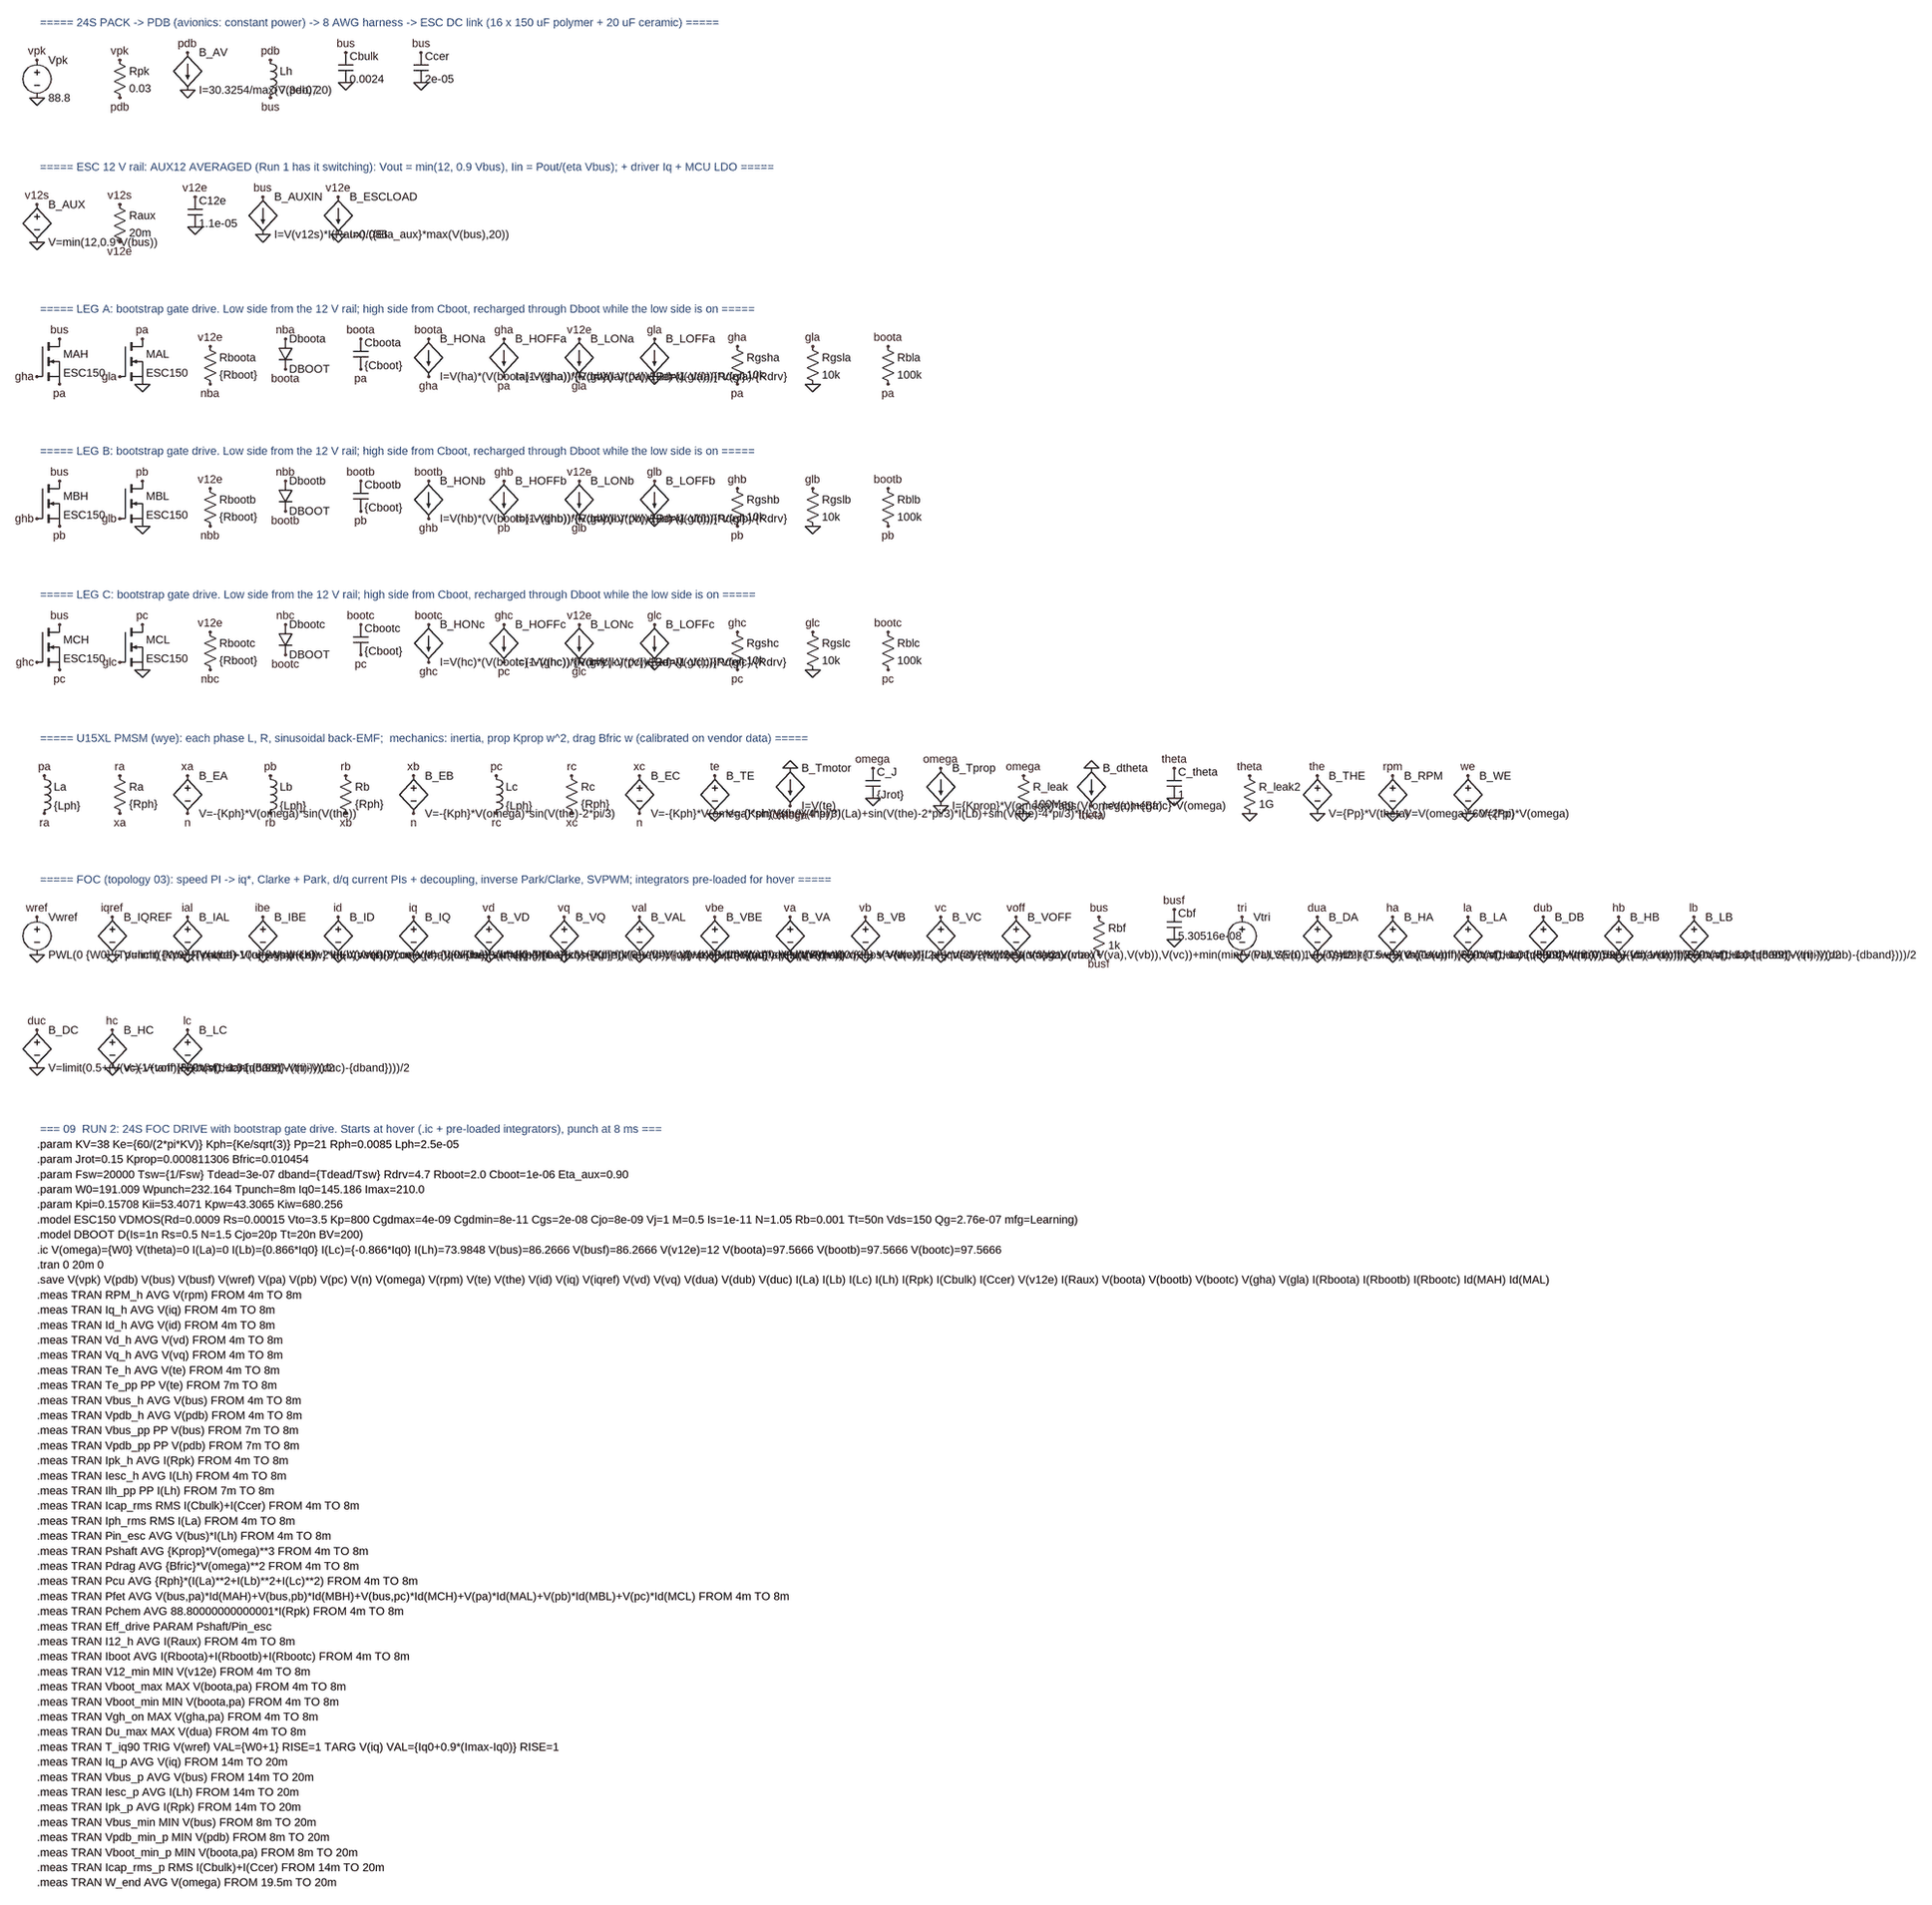
[diagram p0: schematic Drive_24S.asc]
Drive_24S.asc, the LTspice schematic file:
Version 4
SHEET 1 4000 4000
TEXT 32 96 Left 2 ; ===== 24S PACK -> PDB (avionics: constant power) -> 8 AWG harness -> ESC DC link (16 x 150 uF polymer + 20 uF ceramic) =====
SYMBOL voltage 32 160 R0
SYMATTR InstName Vpk
SYMATTR Value 88.8
FLAG 32 176 vpk
FLAG 32 256 0
SYMBOL res 192 160 R0
SYMATTR InstName Rpk
SYMATTR Value 0.03
FLAG 208 176 vpk
FLAG 208 256 pdb
SYMBOL bi 352 160 R0
SYMATTR InstName B_AV
SYMATTR Value I=30.3254/max(V(pdb),20)
FLAG 352 160 pdb
FLAG 352 240 0
SYMBOL ind 512 160 R0
SYMATTR InstName Lh
SYMATTR Value 7.3e-07
SYMATTR SpiceLine Rser=0.0041
FLAG 528 176 pdb
FLAG 528 256 bus
SYMBOL cap 672 160 R0
SYMATTR InstName Cbulk
SYMATTR Value 0.0024
SYMATTR SpiceLine Rser=0.00125
FLAG 688 160 bus
FLAG 688 224 0
SYMBOL cap 832 160 R0
SYMATTR InstName Ccer
SYMATTR Value 2e-05
SYMATTR SpiceLine Rser=1m
FLAG 848 160 bus
FLAG 848 224 0
TEXT 32 456 Left 2 ; ===== ESC 12 V rail: AUX12 AVERAGED (Run 1 has it switching): Vout = min(12, 0.9 Vbus), Iin = Pout/(eta Vbus); + driver Iq + MCU LDO =====
SYMBOL bv 32 520 R0
SYMATTR InstName B_AUX
SYMATTR Value V=min(12,0.9*V(bus))
FLAG 32 536 v12s
FLAG 32 616 0
SYMBOL res 192 520 R0
SYMATTR InstName Raux
SYMATTR Value 20m
FLAG 208 536 v12s
FLAG 208 616 v12e
SYMBOL cap 352 520 R0
SYMATTR InstName C12e
SYMATTR Value 1.1e-05
SYMATTR SpiceLine Rser=0.0025
FLAG 368 520 v12e
FLAG 368 584 0
SYMBOL bi 512 520 R0
SYMATTR InstName B_AUXIN
SYMATTR Value I=V(v12s)*I(Raux)/({Eta_aux}*max(V(bus),20))
FLAG 512 520 bus
FLAG 512 600 0
SYMBOL bi 672 520 R0
SYMATTR InstName B_ESCLOAD
SYMATTR Value I=0.086
FLAG 672 520 v12e
FLAG 672 600 0
TEXT 32 816 Left 2 ; ===== LEG A: bootstrap gate drive. Low side from the 12 V rail; high side from Cboot, recharged through Dboot while the low side is on =====
SYMBOL nmos 32 880 R0
SYMATTR InstName MAH
SYMATTR Value ESC150
FLAG 80 880 bus
FLAG 32 960 gha
FLAG 80 976 pa
SYMBOL nmos 208 880 R0
SYMATTR InstName MAL
SYMATTR Value ESC150
FLAG 256 880 pa
FLAG 208 960 gla
FLAG 256 976 0
SYMBOL res 384 880 R0
SYMATTR InstName Rboota
SYMATTR Value {Rboot}
FLAG 400 896 v12e
FLAG 400 976 nba
SYMBOL diode 544 880 R0
SYMATTR InstName Dboota
SYMATTR Value DBOOT
FLAG 560 880 nba
FLAG 560 944 boota
SYMBOL cap 704 880 R0
SYMATTR InstName Cboota
SYMATTR Value {Cboot}
SYMATTR SpiceLine Rser=5m
FLAG 720 880 boota
FLAG 720 944 pa
SYMBOL bi 864 880 R0
SYMATTR InstName B_HONa
SYMATTR Value I=V(ha)*(V(boota)-V(gha))/{Rdrv}
FLAG 864 880 boota
FLAG 864 960 gha
SYMBOL bi 1024 880 R0
SYMATTR InstName B_HOFFa
SYMATTR Value I=(1-V(ha))*(V(gha)-V(pa))/{Rdrv}
FLAG 1024 880 gha
FLAG 1024 960 pa
SYMBOL bi 1184 880 R0
SYMATTR InstName B_LONa
SYMATTR Value I=V(la)*(V(v12e)-V(gla))/{Rdrv}
FLAG 1184 880 v12e
FLAG 1184 960 gla
SYMBOL bi 1344 880 R0
SYMATTR InstName B_LOFFa
SYMATTR Value I=(1-V(la))*V(gla)/{Rdrv}
FLAG 1344 880 gla
FLAG 1344 960 0
SYMBOL res 1504 880 R0
SYMATTR InstName Rgsha
SYMATTR Value 10k
FLAG 1520 896 gha
FLAG 1520 976 pa
SYMBOL res 1664 880 R0
SYMATTR InstName Rgsla
SYMATTR Value 10k
FLAG 1680 896 gla
FLAG 1680 976 0
SYMBOL res 1824 880 R0
SYMATTR InstName Rbla
SYMATTR Value 100k
FLAG 1840 896 boota
FLAG 1840 976 pa
TEXT 32 1176 Left 2 ; ===== LEG B: bootstrap gate drive. Low side from the 12 V rail; high side from Cboot, recharged through Dboot while the low side is on =====
SYMBOL nmos 32 1240 R0
SYMATTR InstName MBH
SYMATTR Value ESC150
FLAG 80 1240 bus
FLAG 32 1320 ghb
FLAG 80 1336 pb
SYMBOL nmos 208 1240 R0
SYMATTR InstName MBL
SYMATTR Value ESC150
FLAG 256 1240 pb
FLAG 208 1320 glb
FLAG 256 1336 0
SYMBOL res 384 1240 R0
SYMATTR InstName Rbootb
SYMATTR Value {Rboot}
FLAG 400 1256 v12e
FLAG 400 1336 nbb
SYMBOL diode 544 1240 R0
SYMATTR InstName Dbootb
SYMATTR Value DBOOT
FLAG 560 1240 nbb
FLAG 560 1304 bootb
SYMBOL cap 704 1240 R0
SYMATTR InstName Cbootb
SYMATTR Value {Cboot}
SYMATTR SpiceLine Rser=5m
FLAG 720 1240 bootb
FLAG 720 1304 pb
SYMBOL bi 864 1240 R0
SYMATTR InstName B_HONb
SYMATTR Value I=V(hb)*(V(bootb)-V(ghb))/{Rdrv}
FLAG 864 1240 bootb
FLAG 864 1320 ghb
SYMBOL bi 1024 1240 R0
SYMATTR InstName B_HOFFb
SYMATTR Value I=(1-V(hb))*(V(ghb)-V(pb))/{Rdrv}
FLAG 1024 1240 ghb
FLAG 1024 1320 pb
SYMBOL bi 1184 1240 R0
SYMATTR InstName B_LONb
SYMATTR Value I=V(lb)*(V(v12e)-V(glb))/{Rdrv}
FLAG 1184 1240 v12e
FLAG 1184 1320 glb
SYMBOL bi 1344 1240 R0
SYMATTR InstName B_LOFFb
SYMATTR Value I=(1-V(lb))*V(glb)/{Rdrv}
FLAG 1344 1240 glb
FLAG 1344 1320 0
SYMBOL res 1504 1240 R0
SYMATTR InstName Rgshb
SYMATTR Value 10k
FLAG 1520 1256 ghb
FLAG 1520 1336 pb
SYMBOL res 1664 1240 R0
SYMATTR InstName Rgslb
SYMATTR Value 10k
FLAG 1680 1256 glb
FLAG 1680 1336 0
SYMBOL res 1824 1240 R0
SYMATTR InstName Rblb
SYMATTR Value 100k
FLAG 1840 1256 bootb
FLAG 1840 1336 pb
TEXT 32 1536 Left 2 ; ===== LEG C: bootstrap gate drive. Low side from the 12 V rail; high side from Cboot, recharged through Dboot while the low side is on =====
SYMBOL nmos 32 1600 R0
SYMATTR InstName MCH
SYMATTR Value ESC150
FLAG 80 1600 bus
FLAG 32 1680 ghc
FLAG 80 1696 pc
SYMBOL nmos 208 1600 R0
SYMATTR InstName MCL
SYMATTR Value ESC150
FLAG 256 1600 pc
FLAG 208 1680 glc
FLAG 256 1696 0
SYMBOL res 384 1600 R0
SYMATTR InstName Rbootc
SYMATTR Value {Rboot}
FLAG 400 1616 v12e
FLAG 400 1696 nbc
SYMBOL diode 544 1600 R0
SYMATTR InstName Dbootc
SYMATTR Value DBOOT
FLAG 560 1600 nbc
FLAG 560 1664 bootc
SYMBOL cap 704 1600 R0
SYMATTR InstName Cbootc
SYMATTR Value {Cboot}
SYMATTR SpiceLine Rser=5m
FLAG 720 1600 bootc
FLAG 720 1664 pc
SYMBOL bi 864 1600 R0
SYMATTR InstName B_HONc
SYMATTR Value I=V(hc)*(V(bootc)-V(ghc))/{Rdrv}
FLAG 864 1600 bootc
FLAG 864 1680 ghc
SYMBOL bi 1024 1600 R0
SYMATTR InstName B_HOFFc
SYMATTR Value I=(1-V(hc))*(V(ghc)-V(pc))/{Rdrv}
FLAG 1024 1600 ghc
FLAG 1024 1680 pc
SYMBOL bi 1184 1600 R0
SYMATTR InstName B_LONc
SYMATTR Value I=V(lc)*(V(v12e)-V(glc))/{Rdrv}
FLAG 1184 1600 v12e
FLAG 1184 1680 glc
SYMBOL bi 1344 1600 R0
SYMATTR InstName B_LOFFc
SYMATTR Value I=(1-V(lc))*V(glc)/{Rdrv}
FLAG 1344 1600 glc
FLAG 1344 1680 0
SYMBOL res 1504 1600 R0
SYMATTR InstName Rgshc
SYMATTR Value 10k
FLAG 1520 1616 ghc
FLAG 1520 1696 pc
SYMBOL res 1664 1600 R0
SYMATTR InstName Rgslc
SYMATTR Value 10k
FLAG 1680 1616 glc
FLAG 1680 1696 0
SYMBOL res 1824 1600 R0
SYMATTR InstName Rblc
SYMATTR Value 100k
FLAG 1840 1616 bootc
FLAG 1840 1696 pc
TEXT 32 1896 Left 2 ; ===== U15XL PMSM (wye): each phase L, R, sinusoidal back-EMF;  mechanics: inertia, prop Kprop w^2, drag Bfric w (calibrated on vendor data) =====
SYMBOL ind 32 1960 R0
SYMATTR InstName La
SYMATTR Value {Lph}
FLAG 48 1976 pa
FLAG 48 2056 ra
SYMBOL res 192 1960 R0
SYMATTR InstName Ra
SYMATTR Value {Rph}
FLAG 208 1976 ra
FLAG 208 2056 xa
SYMBOL bv 352 1960 R0
SYMATTR InstName B_EA
SYMATTR Value V=-{Kph}*V(omega)*sin(V(the))
FLAG 352 1976 xa
FLAG 352 2056 n
SYMBOL ind 512 1960 R0
SYMATTR InstName Lb
SYMATTR Value {Lph}
FLAG 528 1976 pb
FLAG 528 2056 rb
SYMBOL res 672 1960 R0
SYMATTR InstName Rb
SYMATTR Value {Rph}
FLAG 688 1976 rb
FLAG 688 2056 xb
SYMBOL bv 832 1960 R0
SYMATTR InstName B_EB
SYMATTR Value V=-{Kph}*V(omega)*sin(V(the)-2*pi/3)
FLAG 832 1976 xb
FLAG 832 2056 n
SYMBOL ind 992 1960 R0
SYMATTR InstName Lc
SYMATTR Value {Lph}
FLAG 1008 1976 pc
FLAG 1008 2056 rc
SYMBOL res 1152 1960 R0
SYMATTR InstName Rc
SYMATTR Value {Rph}
FLAG 1168 1976 rc
FLAG 1168 2056 xc
SYMBOL bv 1312 1960 R0
SYMATTR InstName B_EC
SYMATTR Value V=-{Kph}*V(omega)*sin(V(the)-4*pi/3)
FLAG 1312 1976 xc
FLAG 1312 2056 n
SYMBOL bv 1472 1960 R0
SYMATTR InstName B_TE
SYMATTR Value V=-{Kph}*(sin(V(the))*I(La)+sin(V(the)-2*pi/3)*I(Lb)+sin(V(the)-4*pi/3)*I(Lc))
FLAG 1472 1976 te
FLAG 1472 2056 0
SYMBOL bi 1632 1960 R0
SYMATTR InstName B_Tmotor
SYMATTR Value I=V(te)
FLAG 1632 1960 0
FLAG 1632 2040 omega
SYMBOL cap 1792 1960 R0
SYMATTR InstName C_J
SYMATTR Value {Jrot}
FLAG 1808 1960 omega
FLAG 1808 2024 0
SYMBOL bi 1952 1960 R0
SYMATTR InstName B_Tprop
SYMATTR Value I={Kprop}*V(omega)*abs(V(omega))+{Bfric}*V(omega)
FLAG 1952 1960 omega
FLAG 1952 2040 0
SYMBOL res 2112 1960 R0
SYMATTR InstName R_leak
SYMATTR Value 100Meg
FLAG 2128 1976 omega
FLAG 2128 2056 0
SYMBOL bi 2272 1960 R0
SYMATTR InstName B_dtheta
SYMATTR Value I=V(omega)
FLAG 2272 1960 0
FLAG 2272 2040 theta
SYMBOL cap 2432 1960 R0
SYMATTR InstName C_theta
SYMATTR Value 1
FLAG 2448 1960 theta
FLAG 2448 2024 0
SYMBOL res 2592 1960 R0
SYMATTR InstName R_leak2
SYMATTR Value 1G
FLAG 2608 1976 theta
FLAG 2608 2056 0
SYMBOL bv 2752 1960 R0
SYMATTR InstName B_THE
SYMATTR Value V={Pp}*V(theta)
FLAG 2752 1976 the
FLAG 2752 2056 0
SYMBOL bv 2912 1960 R0
SYMATTR InstName B_RPM
SYMATTR Value V=V(omega)*60/(2*pi)
FLAG 2912 1976 rpm
FLAG 2912 2056 0
SYMBOL bv 3072 1960 R0
SYMATTR InstName B_WE
SYMATTR Value V={Pp}*V(omega)
FLAG 3072 1976 we
FLAG 3072 2056 0
TEXT 32 2256 Left 2 ; ===== FOC (topology 03): speed PI -> iq*, Clarke + Park, d/q current PIs + decoupling, inverse Park/Clarke, SVPWM; integrators pre-loaded for hover =====
SYMBOL voltage 32 2320 R0
SYMATTR InstName Vwref
SYMATTR Value PWL(0 {W0} {Tpunch} {W0} {Tpunch+10u} {Wpunch})
FLAG 32 2336 wref
FLAG 32 2416 0
SYMBOL bv 192 2320 R0
SYMATTR InstName B_IQREF
SYMATTR Value V=limit({Kpw}*(V(wref)-V(omega))+{Kiw}*idt(V(wref)-V(omega),{Iq0/Kiw}),-{Imax},{Imax})
FLAG 192 2336 iqref
FLAG 192 2416 0
SYMBOL bv 352 2320 R0
SYMATTR InstName B_IAL
SYMATTR Value V=I(La)
FLAG 352 2336 ial
FLAG 352 2416 0
SYMBOL bv 512 2320 R0
SYMATTR InstName B_IBE
SYMATTR Value V=(I(La)+2*I(Lb))/sqrt(3)
FLAG 512 2336 ibe
FLAG 512 2416 0
SYMBOL bv 672 2320 R0
SYMATTR InstName B_ID
SYMATTR Value V=V(ial)*cos(V(the))+V(ibe)*sin(V(the))
FLAG 672 2336 id
FLAG 672 2416 0
SYMBOL bv 832 2320 R0
SYMATTR InstName B_IQ
SYMATTR Value V=-V(ial)*sin(V(the))+V(ibe)*cos(V(the))
FLAG 832 2336 iq
FLAG 832 2416 0
SYMBOL bv 992 2320 R0
SYMATTR InstName B_VD
SYMATTR Value V={Kpi}*(0-V(id))+{Kii}*idt(0-V(id)) - V(we)*{Lph}*V(iq)
FLAG 992 2336 vd
FLAG 992 2416 0
SYMBOL bv 1152 2320 R0
SYMATTR InstName B_VQ
SYMATTR Value V={Kpi}*(V(iqref)-V(iq))+{Kii}*idt(V(iqref)-V(iq),{Rph*Iq0/Kii}) + V(we)*{Lph}*V(id)+{Kph}*V(omega)
FLAG 1152 2336 vq
FLAG 1152 2416 0
SYMBOL bv 1312 2320 R0
SYMATTR InstName B_VAL
SYMATTR Value V=V(vd)*cos(V(the))-V(vq)*sin(V(the))
FLAG 1312 2336 val
FLAG 1312 2416 0
SYMBOL bv 1472 2320 R0
SYMATTR InstName B_VBE
SYMATTR Value V=V(vd)*sin(V(the))+V(vq)*cos(V(the))
FLAG 1472 2336 vbe
FLAG 1472 2416 0
SYMBOL bv 1632 2320 R0
SYMATTR InstName B_VA
SYMATTR Value V=V(val)
FLAG 1632 2336 va
FLAG 1632 2416 0
SYMBOL bv 1792 2320 R0
SYMATTR InstName B_VB
SYMATTR Value V=-V(val)/2+sqrt(3)/2*V(vbe)
FLAG 1792 2336 vb
FLAG 1792 2416 0
SYMBOL bv 1952 2320 R0
SYMATTR InstName B_VC
SYMATTR Value V=-V(val)/2-sqrt(3)/2*V(vbe)
FLAG 1952 2336 vc
FLAG 1952 2416 0
SYMBOL bv 2112 2320 R0
SYMATTR InstName B_VOFF
SYMATTR Value V=(max(max(V(va),V(vb)),V(vc))+min(min(V(va),V(vb)),V(vc)))/2
FLAG 2112 2336 voff
FLAG 2112 2416 0
SYMBOL res 2272 2320 R0
SYMATTR InstName Rbf
SYMATTR Value 1k
FLAG 2288 2336 bus
FLAG 2288 2416 busf
SYMBOL cap 2432 2320 R0
SYMATTR InstName Cbf
SYMATTR Value 5.30516e-08
FLAG 2448 2320 busf
FLAG 2448 2384 0
SYMBOL voltage 2592 2320 R0
SYMATTR InstName Vtri
SYMATTR Value PULSE(0 1 0 {Tsw/2} {Tsw/2} 0 {Tsw})
FLAG 2592 2336 tri
FLAG 2592 2416 0
SYMBOL bv 2752 2320 R0
SYMATTR InstName B_DA
SYMATTR Value V=limit(0.5+(V(va)-V(voff))/V(busf), 0.01, 0.99)
FLAG 2752 2336 dua
FLAG 2752 2416 0
SYMBOL bv 2912 2320 R0
SYMATTR InstName B_HA
SYMATTR Value V=(1+tanh(500*(V(dua)-{dband}-V(tri))))/2
FLAG 2912 2336 ha
FLAG 2912 2416 0
SYMBOL bv 3072 2320 R0
SYMATTR InstName B_LA
SYMATTR Value V=(1+tanh(500*(V(tri)-V(dua)-{dband})))/2
FLAG 3072 2336 la
FLAG 3072 2416 0
SYMBOL bv 3232 2320 R0
SYMATTR InstName B_DB
SYMATTR Value V=limit(0.5+(V(vb)-V(voff))/V(busf), 0.01, 0.99)
FLAG 3232 2336 dub
FLAG 3232 2416 0
SYMBOL bv 3392 2320 R0
SYMATTR InstName B_HB
SYMATTR Value V=(1+tanh(500*(V(dub)-{dband}-V(tri))))/2
FLAG 3392 2336 hb
FLAG 3392 2416 0
SYMBOL bv 3552 2320 R0
SYMATTR InstName B_LB
SYMATTR Value V=(1+tanh(500*(V(tri)-V(dub)-{dband})))/2
FLAG 3552 2336 lb
FLAG 3552 2416 0
SYMBOL bv 32 2560 R0
SYMATTR InstName B_DC
SYMATTR Value V=limit(0.5+(V(vc)-V(voff))/V(busf), 0.01, 0.99)
FLAG 32 2576 duc
FLAG 32 2656 0
SYMBOL bv 192 2560 R0
SYMATTR InstName B_HC
SYMATTR Value V=(1+tanh(500*(V(duc)-{dband}-V(tri))))/2
FLAG 192 2576 hc
FLAG 192 2656 0
SYMBOL bv 352 2560 R0
SYMATTR InstName B_LC
SYMATTR Value V=(1+tanh(500*(V(tri)-V(duc)-{dband})))/2
FLAG 352 2576 lc
FLAG 352 2656 0
TEXT 32 3000 Left 2 ; === 09  RUN 2: 24S FOC DRIVE with bootstrap gate drive. Starts at hover (.ic + pre-loaded integrators), punch at 8 ms ===
TEXT 32 3032 Left 2 !.param KV=38 Ke={60/(2*pi*KV)} Kph={Ke/sqrt(3)} Pp=21 Rph=0.0085 Lph=2.5e-05
TEXT 32 3064 Left 2 !.param Jrot=0.15 Kprop=0.000811306 Bfric=0.010454
TEXT 32 3096 Left 2 !.param Fsw=20000 Tsw={1/Fsw} Tdead=3e-07 dband={Tdead/Tsw} Rdrv=4.7 Rboot=2.0 Cboot=1e-06 Eta_aux=0.90
TEXT 32 3128 Left 2 !.param W0=191.009 Wpunch=232.164 Tpunch=8m Iq0=145.186 Imax=210.0
TEXT 32 3160 Left 2 !.param Kpi=0.15708 Kii=53.4071 Kpw=43.3065 Kiw=680.256
TEXT 32 3192 Left 2 !.model ESC150 VDMOS(Rd=0.0009 Rs=0.00015 Vto=3.5 Kp=800 Cgdmax=4e-09 Cgdmin=8e-11 Cgs=2e-08 Cjo=8e-09 Vj=1 M=0.5 Is=1e-11 N=1.05 Rb=0.001 Tt=50n Vds=150 Qg=2.76e-07 mfg=Learning)
TEXT 32 3224 Left 2 !.model DBOOT D(Is=1n Rs=0.5 N=1.5 Cjo=20p Tt=20n BV=200)
TEXT 32 3256 Left 2 !.ic V(omega)={W0} V(theta)=0 I(La)=0 I(Lb)={0.866*Iq0} I(Lc)={-0.866*Iq0} I(Lh)=73.9848 V(bus)=86.2666 V(busf)=86.2666 V(v12e)=12 V(boota)=97.5666 V(bootb)=97.5666 V(bootc)=97.5666
TEXT 32 3288 Left 2 !.tran 0 20m 0
TEXT 32 3320 Left 2 !.save V(vpk) V(pdb) V(bus) V(busf) V(wref) V(pa) V(pb) V(pc) V(n) V(omega) V(rpm) V(te) V(the) V(id) V(iq) V(iqref) V(vd) V(vq) V(dua) V(dub) V(duc) I(La) I(Lb) I(Lc) I(Lh) I(Rpk) I(Cbulk) I(Ccer) V(v12e) I(Raux) V(boota) V(bootb) V(bootc) V(gha) V(gla) I(Rboota) I(Rbootb) I(Rbootc) Id(MAH) Id(MAL) Id(MBH) Id(MBL) Id(MCH) Id(MCL)
TEXT 32 3352 Left 2 !.meas TRAN RPM_h AVG V(rpm) FROM 4m TO 8m
TEXT 32 3384 Left 2 !.meas TRAN Iq_h AVG V(iq) FROM 4m TO 8m
TEXT 32 3416 Left 2 !.meas TRAN Id_h AVG V(id) FROM 4m TO 8m
TEXT 32 3448 Left 2 !.meas TRAN Vd_h AVG V(vd) FROM 4m TO 8m
TEXT 32 3480 Left 2 !.meas TRAN Vq_h AVG V(vq) FROM 4m TO 8m
TEXT 32 3512 Left 2 !.meas TRAN Te_h AVG V(te) FROM 4m TO 8m
TEXT 32 3544 Left 2 !.meas TRAN Te_pp PP V(te) FROM 7m TO 8m
TEXT 32 3576 Left 2 !.meas TRAN Vbus_h AVG V(bus) FROM 4m TO 8m
TEXT 32 3608 Left 2 !.meas TRAN Vpdb_h AVG V(pdb) FROM 4m TO 8m
TEXT 32 3640 Left 2 !.meas TRAN Vbus_pp PP V(bus) FROM 7m TO 8m
TEXT 32 3672 Left 2 !.meas TRAN Vpdb_pp PP V(pdb) FROM 7m TO 8m
TEXT 32 3704 Left 2 !.meas TRAN Ipk_h AVG I(Rpk) FROM 4m TO 8m
TEXT 32 3736 Left 2 !.meas TRAN Iesc_h AVG I(Lh) FROM 4m TO 8m
TEXT 32 3768 Left 2 !.meas TRAN Ilh_pp PP I(Lh) FROM 7m TO 8m
TEXT 32 3800 Left 2 !.meas TRAN Icap_rms RMS I(Cbulk)+I(Ccer) FROM 4m TO 8m
TEXT 32 3832 Left 2 !.meas TRAN Iph_rms RMS I(La) FROM 4m TO 8m
TEXT 32 3864 Left 2 !.meas TRAN Pin_esc AVG V(bus)*I(Lh) FROM 4m TO 8m
TEXT 32 3896 Left 2 !.meas TRAN Pshaft AVG {Kprop}*V(omega)**3 FROM 4m TO 8m
TEXT 32 3928 Left 2 !.meas TRAN Pdrag AVG {Bfric}*V(omega)**2 FROM 4m TO 8m
TEXT 32 3960 Left 2 !.meas TRAN Pcu AVG {Rph}*(I(La)**2+I(Lb)**2+I(Lc)**2) FROM 4m TO 8m
TEXT 32 3992 Left 2 !.meas TRAN Pfet AVG V(bus,pa)*Id(MAH)+V(bus,pb)*Id(MBH)+V(bus,pc)*Id(MCH)+V(pa)*Id(MAL)+V(pb)*Id(MBL)+V(pc)*Id(MCL) FROM 4m TO 8m
TEXT 32 4024 Left 2 !.meas TRAN Pchem AVG 88.80000000000001*I(Rpk) FROM 4m TO 8m
TEXT 32 4056 Left 2 !.meas TRAN Eff_drive PARAM Pshaft/Pin_esc
TEXT 32 4088 Left 2 !.meas TRAN I12_h AVG I(Raux) FROM 4m TO 8m
TEXT 32 4120 Left 2 !.meas TRAN Iboot AVG I(Rboota)+I(Rbootb)+I(Rbootc) FROM 4m TO 8m
TEXT 32 4152 Left 2 !.meas TRAN V12_min MIN V(v12e) FROM 4m TO 8m
TEXT 32 4184 Left 2 !.meas TRAN Vboot_max MAX V(boota,pa) FROM 4m TO 8m
TEXT 32 4216 Left 2 !.meas TRAN Vboot_min MIN V(boota,pa) FROM 4m TO 8m
TEXT 32 4248 Left 2 !.meas TRAN Vgh_on MAX V(gha,pa) FROM 4m TO 8m
TEXT 32 4280 Left 2 !.meas TRAN Du_max MAX V(dua) FROM 4m TO 8m
TEXT 32 4312 Left 2 !.meas TRAN T_iq90 TRIG V(wref) VAL={W0+1} RISE=1 TARG V(iq) VAL={Iq0+0.9*(Imax-Iq0)} RISE=1
TEXT 32 4344 Left 2 !.meas TRAN Iq_p AVG V(iq) FROM 14m TO 20m
TEXT 32 4376 Left 2 !.meas TRAN Vbus_p AVG V(bus) FROM 14m TO 20m
TEXT 32 4408 Left 2 !.meas TRAN Iesc_p AVG I(Lh) FROM 14m TO 20m
TEXT 32 4440 Left 2 !.meas TRAN Ipk_p AVG I(Rpk) FROM 14m TO 20m
TEXT 32 4472 Left 2 !.meas TRAN Vbus_min MIN V(bus) FROM 8m TO 20m
TEXT 32 4504 Left 2 !.meas TRAN Vpdb_min_p MIN V(pdb) FROM 8m TO 20m
TEXT 32 4536 Left 2 !.meas TRAN Vboot_min_p MIN V(boota,pa) FROM 8m TO 20m
TEXT 32 4568 Left 2 !.meas TRAN Icap_rms_p RMS I(Cbulk)+I(Ccer) FROM 14m TO 20m
TEXT 32 4600 Left 2 !.meas TRAN W_end AVG V(omega) FROM 19.5m TO 20m

The netlist it stands for:
* Drive_24S.asc
Vpk vpk 0 88.8
Rpk vpk pdb 0.03
B_AV pdb 0 I=30.3254/max(V(pdb),20)
Lh pdb bus 7.3e-07 Rser=0.0041
Cbulk bus 0 0.0024 Rser=0.00125
Ccer bus 0 2e-05 Rser=1m
B_AUX v12s 0 V=min(12,0.9*V(bus))
Raux v12s v12e 20m
C12e v12e 0 1.1e-05 Rser=0.0025
B_AUXIN bus 0 I=V(v12s)*I(Raux)/({Eta_aux}*max(V(bus),20))
B_ESCLOAD v12e 0 I=0.086
MAH bus gha pa pa ESC150
MAL pa gla 0 0 ESC150
Rboota v12e nba {Rboot}
Dboota nba boota DBOOT
Cboota boota pa {Cboot} Rser=5m
B_HONa boota gha I=V(ha)*(V(boota)-V(gha))/{Rdrv}
B_HOFFa gha pa I=(1-V(ha))*(V(gha)-V(pa))/{Rdrv}
B_LONa v12e gla I=V(la)*(V(v12e)-V(gla))/{Rdrv}
B_LOFFa gla 0 I=(1-V(la))*V(gla)/{Rdrv}
Rgsha gha pa 10k
Rgsla gla 0 10k
Rbla boota pa 100k
MBH bus ghb pb pb ESC150
MBL pb glb 0 0 ESC150
Rbootb v12e nbb {Rboot}
Dbootb nbb bootb DBOOT
Cbootb bootb pb {Cboot} Rser=5m
B_HONb bootb ghb I=V(hb)*(V(bootb)-V(ghb))/{Rdrv}
B_HOFFb ghb pb I=(1-V(hb))*(V(ghb)-V(pb))/{Rdrv}
B_LONb v12e glb I=V(lb)*(V(v12e)-V(glb))/{Rdrv}
B_LOFFb glb 0 I=(1-V(lb))*V(glb)/{Rdrv}
Rgshb ghb pb 10k
Rgslb glb 0 10k
Rblb bootb pb 100k
MCH bus ghc pc pc ESC150
MCL pc glc 0 0 ESC150
Rbootc v12e nbc {Rboot}
Dbootc nbc bootc DBOOT
Cbootc bootc pc {Cboot} Rser=5m
B_HONc bootc ghc I=V(hc)*(V(bootc)-V(ghc))/{Rdrv}
B_HOFFc ghc pc I=(1-V(hc))*(V(ghc)-V(pc))/{Rdrv}
B_LONc v12e glc I=V(lc)*(V(v12e)-V(glc))/{Rdrv}
B_LOFFc glc 0 I=(1-V(lc))*V(glc)/{Rdrv}
Rgshc ghc pc 10k
Rgslc glc 0 10k
Rblc bootc pc 100k
La pa ra {Lph}
Ra ra xa {Rph}
B_EA xa n V=-{Kph}*V(omega)*sin(V(the))
Lb pb rb {Lph}
Rb rb xb {Rph}
B_EB xb n V=-{Kph}*V(omega)*sin(V(the)-2*pi/3)
Lc pc rc {Lph}
Rc rc xc {Rph}
B_EC xc n V=-{Kph}*V(omega)*sin(V(the)-4*pi/3)
B_TE te 0 V=-{Kph}*(sin(V(the))*I(La)+sin(V(the)-2*pi/3)*I(Lb)+sin(V(the)-4*pi/3)*I(Lc))
B_Tmotor 0 omega I=V(te)
C_J omega 0 {Jrot}
B_Tprop omega 0 I={Kprop}*V(omega)*abs(V(omega))+{Bfric}*V(omega)
R_leak omega 0 100Meg
B_dtheta 0 theta I=V(omega)
C_theta theta 0 1
R_leak2 theta 0 1G
B_THE the 0 V={Pp}*V(theta)
B_RPM rpm 0 V=V(omega)*60/(2*pi)
B_WE we 0 V={Pp}*V(omega)
Vwref wref 0 PWL(0 {W0} {Tpunch} {W0} {Tpunch+10u} {Wpunch})
B_IQREF iqref 0 V=limit({Kpw}*(V(wref)-V(omega))+{Kiw}*idt(V(wref)-V(omega),{Iq0/Kiw}),-{Imax},{Imax})
B_IAL ial 0 V=I(La)
B_IBE ibe 0 V=(I(La)+2*I(Lb))/sqrt(3)
B_ID id 0 V=V(ial)*cos(V(the))+V(ibe)*sin(V(the))
B_IQ iq 0 V=-V(ial)*sin(V(the))+V(ibe)*cos(V(the))
B_VD vd 0 V={Kpi}*(0-V(id))+{Kii}*idt(0-V(id)) - V(we)*{Lph}*V(iq)
B_VQ vq 0 V={Kpi}*(V(iqref)-V(iq))+{Kii}*idt(V(iqref)-V(iq),{Rph*Iq0/Kii}) + V(we)*{Lph}*V(id)+{Kph}*V(omega)
B_VAL val 0 V=V(vd)*cos(V(the))-V(vq)*sin(V(the))
B_VBE vbe 0 V=V(vd)*sin(V(the))+V(vq)*cos(V(the))
B_VA va 0 V=V(val)
B_VB vb 0 V=-V(val)/2+sqrt(3)/2*V(vbe)
B_VC vc 0 V=-V(val)/2-sqrt(3)/2*V(vbe)
B_VOFF voff 0 V=(max(max(V(va),V(vb)),V(vc))+min(min(V(va),V(vb)),V(vc)))/2
Rbf bus busf 1k
Cbf busf 0 5.30516e-08
Vtri tri 0 PULSE(0 1 0 {Tsw/2} {Tsw/2} 0 {Tsw})
B_DA dua 0 V=limit(0.5+(V(va)-V(voff))/V(busf), 0.01, 0.99)
B_HA ha 0 V=(1+tanh(500*(V(dua)-{dband}-V(tri))))/2
B_LA la 0 V=(1+tanh(500*(V(tri)-V(dua)-{dband})))/2
B_DB dub 0 V=limit(0.5+(V(vb)-V(voff))/V(busf), 0.01, 0.99)
B_HB hb 0 V=(1+tanh(500*(V(dub)-{dband}-V(tri))))/2
B_LB lb 0 V=(1+tanh(500*(V(tri)-V(dub)-{dband})))/2
B_DC duc 0 V=limit(0.5+(V(vc)-V(voff))/V(busf), 0.01, 0.99)
B_HC hc 0 V=(1+tanh(500*(V(duc)-{dband}-V(tri))))/2
B_LC lc 0 V=(1+tanh(500*(V(tri)-V(duc)-{dband})))/2
.model D D
.lib standard.dio
.model NMOS NMOS
.model PMOS PMOS
.lib standard.mos
*  ===== 24S PACK -> PDB (avionics: constant power) -> 8 AWG harness -> ESC DC link (16 x 150 uF polymer + 20 uF ceramic) =====
*  ===== ESC 12 V rail: AUX12 AVERAGED (Run 1 has it switching): Vout = min(12, 0.9 Vbus), Iin = Pout/(eta Vbus); + driver Iq + MCU LDO =====
*  ===== LEG A: bootstrap gate drive. Low side from the 12 V rail; high side from Cboot, recharged through Dboot while the low side is on =====
*  ===== LEG B: bootstrap gate drive. Low side from the 12 V rail; high side from Cboot, recharged through Dboot while the low side is on =====
*  ===== LEG C: bootstrap gate drive. Low side from the 12 V rail; high side from Cboot, recharged through Dboot while the low side is on =====
*  ===== U15XL PMSM (wye): each phase L, R, sinusoidal back-EMF;  mechanics: inertia, prop Kprop w^2, drag Bfric w (calibrated on vendor data) =====
*  ===== FOC (topology 03): speed PI -> iq*, Clarke + Park, d/q current PIs + decoupling, inverse Park/Clarke, SVPWM; integrators pre-loaded for hover =====
*  === 09  RUN 2: 24S FOC DRIVE with bootstrap gate drive. Starts at hover (.ic + pre-loaded integrators), punch at 8 ms ===
.param KV=38 Ke={60/(2*pi*KV)} Kph={Ke/sqrt(3)} Pp=21 Rph=0.0085 Lph=2.5e-05
.param Jrot=0.15 Kprop=0.000811306 Bfric=0.010454
.param Fsw=20000 Tsw={1/Fsw} Tdead=3e-07 dband={Tdead/Tsw} Rdrv=4.7 Rboot=2.0 Cboot=1e-06 Eta_aux=0.90
.param W0=191.009 Wpunch=232.164 Tpunch=8m Iq0=145.186 Imax=210.0
.param Kpi=0.15708 Kii=53.4071 Kpw=43.3065 Kiw=680.256
.model ESC150 VDMOS(Rd=0.0009 Rs=0.00015 Vto=3.5 Kp=800 Cgdmax=4e-09 Cgdmin=8e-11 Cgs=2e-08 Cjo=8e-09 Vj=1 M=0.5 Is=1e-11 N=1.05 Rb=0.001 Tt=50n Vds=150 Qg=2.76e-07 mfg=Learning)
.model DBOOT D(Is=1n Rs=0.5 N=1.5 Cjo=20p Tt=20n BV=200)
.ic V(omega)={W0} V(theta)=0 I(La)=0 I(Lb)={0.866*Iq0} I(Lc)={-0.866*Iq0} I(Lh)=73.9848 V(bus)=86.2666 V(busf)=86.2666 V(v12e)=12 V(boota)=97.5666 V(bootb)=97.5666 V(bootc)=97.5666
.tran 0 20m 0
.save V(vpk) V(pdb) V(bus) V(busf) V(wref) V(pa) V(pb) V(pc) V(n) V(omega) V(rpm) V(te) V(the) V(id) V(iq) V(iqref) V(vd) V(vq) V(dua) V(dub) V(duc) I(La) I(Lb) I(Lc) I(Lh) I(Rpk) I(Cbulk) I(Ccer) V(v12e) I(Raux) V(boota) V(bootb) V(bootc) V(gha) V(gla) I(Rboota) I(Rbootb) I(Rbootc) Id(MAH) Id(MAL) Id(MBH) Id(MBL) Id(MCH) Id(MCL)
.meas TRAN RPM_h AVG V(rpm) FROM 4m TO 8m
.meas TRAN Iq_h AVG V(iq) FROM 4m TO 8m
.meas TRAN Id_h AVG V(id) FROM 4m TO 8m
.meas TRAN Vd_h AVG V(vd) FROM 4m TO 8m
.meas TRAN Vq_h AVG V(vq) FROM 4m TO 8m
.meas TRAN Te_h AVG V(te) FROM 4m TO 8m
.meas TRAN Te_pp PP V(te) FROM 7m TO 8m
.meas TRAN Vbus_h AVG V(bus) FROM 4m TO 8m
.meas TRAN Vpdb_h AVG V(pdb) FROM 4m TO 8m
.meas TRAN Vbus_pp PP V(bus) FROM 7m TO 8m
.meas TRAN Vpdb_pp PP V(pdb) FROM 7m TO 8m
.meas TRAN Ipk_h AVG I(Rpk) FROM 4m TO 8m
.meas TRAN Iesc_h AVG I(Lh) FROM 4m TO 8m
.meas TRAN Ilh_pp PP I(Lh) FROM 7m TO 8m
.meas TRAN Icap_rms RMS I(Cbulk)+I(Ccer) FROM 4m TO 8m
.meas TRAN Iph_rms RMS I(La) FROM 4m TO 8m
.meas TRAN Pin_esc AVG V(bus)*I(Lh) FROM 4m TO 8m
.meas TRAN Pshaft AVG {Kprop}*V(omega)**3 FROM 4m TO 8m
.meas TRAN Pdrag AVG {Bfric}*V(omega)**2 FROM 4m TO 8m
.meas TRAN Pcu AVG {Rph}*(I(La)**2+I(Lb)**2+I(Lc)**2) FROM 4m TO 8m
.meas TRAN Pfet AVG V(bus,pa)*Id(MAH)+V(bus,pb)*Id(MBH)+V(bus,pc)*Id(MCH)+V(pa)*Id(MAL)+V(pb)*Id(MBL)+V(pc)*Id(MCL) FROM 4m TO 8m
.meas TRAN Pchem AVG 88.80000000000001*I(Rpk) FROM 4m TO 8m
.meas TRAN Eff_drive PARAM Pshaft/Pin_esc
.meas TRAN I12_h AVG I(Raux) FROM 4m TO 8m
.meas TRAN Iboot AVG I(Rboota)+I(Rbootb)+I(Rbootc) FROM 4m TO 8m
.meas TRAN V12_min MIN V(v12e) FROM 4m TO 8m
.meas TRAN Vboot_max MAX V(boota,pa) FROM 4m TO 8m
.meas TRAN Vboot_min MIN V(boota,pa) FROM 4m TO 8m
.meas TRAN Vgh_on MAX V(gha,pa) FROM 4m TO 8m
.meas TRAN Du_max MAX V(dua) FROM 4m TO 8m
.meas TRAN T_iq90 TRIG V(wref) VAL={W0+1} RISE=1 TARG V(iq) VAL={Iq0+0.9*(Imax-Iq0)} RISE=1
.meas TRAN Iq_p AVG V(iq) FROM 14m TO 20m
.meas TRAN Vbus_p AVG V(bus) FROM 14m TO 20m
.meas TRAN Iesc_p AVG I(Lh) FROM 14m TO 20m
.meas TRAN Ipk_p AVG I(Rpk) FROM 14m TO 20m
.meas TRAN Vbus_min MIN V(bus) FROM 8m TO 20m
.meas TRAN Vpdb_min_p MIN V(pdb) FROM 8m TO 20m
.meas TRAN Vboot_min_p MIN V(boota,pa) FROM 8m TO 20m
.meas TRAN Icap_rms_p RMS I(Cbulk)+I(Ccer) FROM 14m TO 20m
.meas TRAN W_end AVG V(omega) FROM 19.5m TO 20m
.backanno
.end